# Altium schematic sheet Battery_Charging_Section.SchDoc: =Projectname
size A4; SheetNumber: 3; SheetTotal: 4
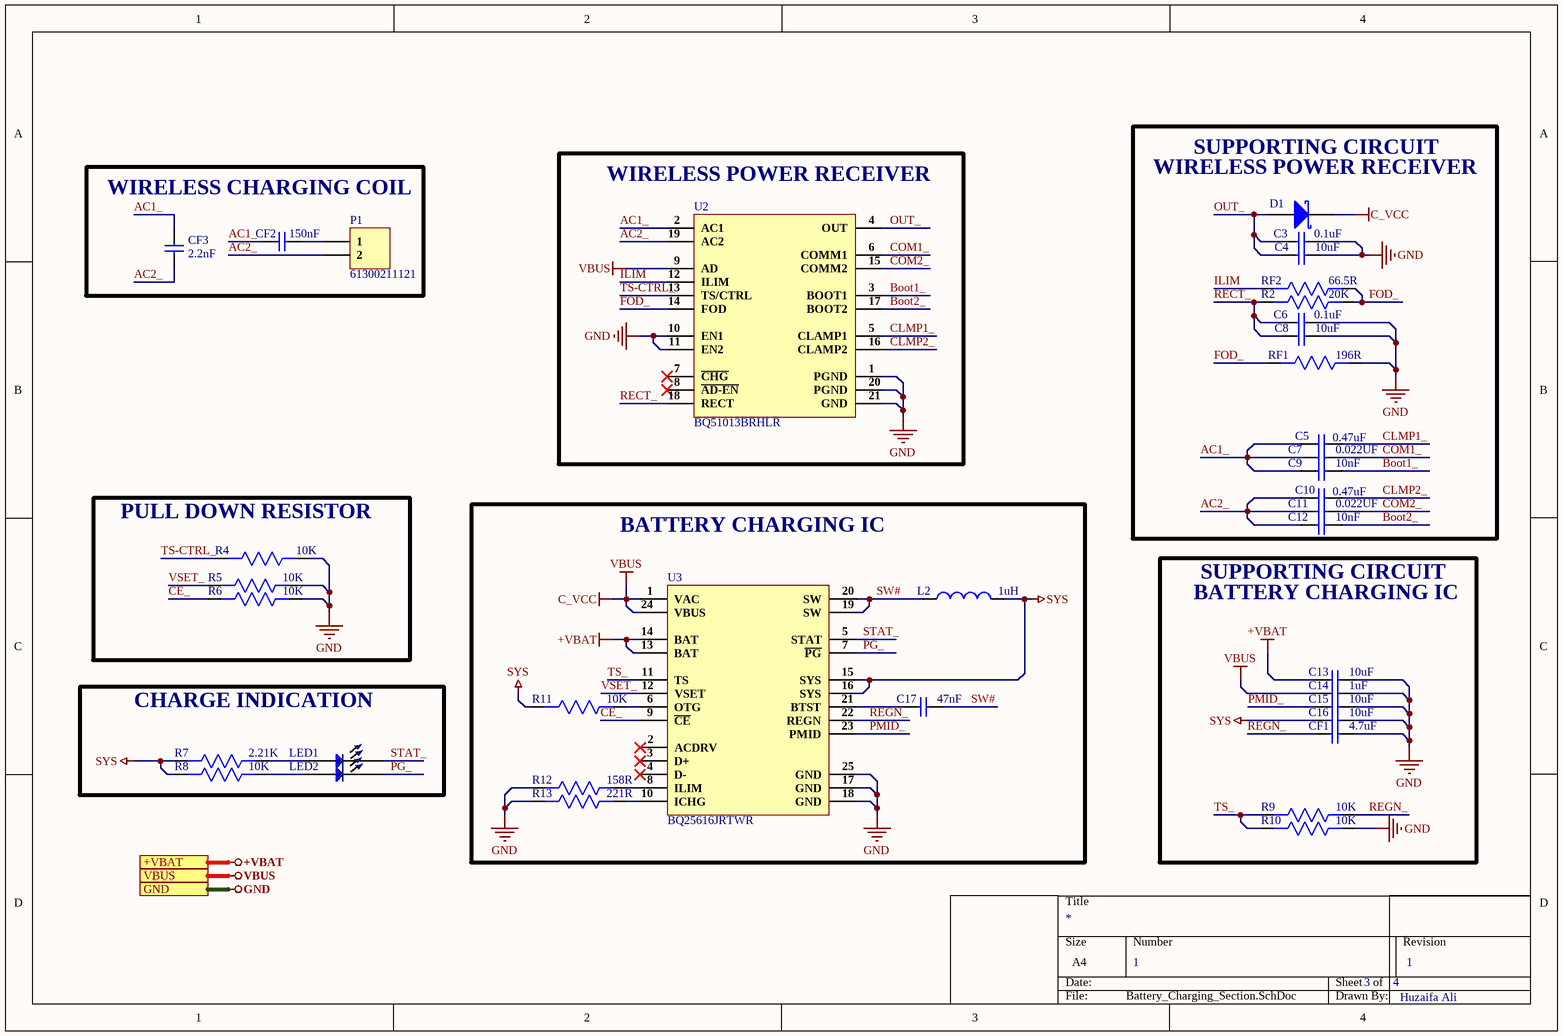
[diagram p0: Battery_Charging_Section.SchDoc]

## Parts
C3  0.1uF  [Cap0402]
C4  10uF  [Cap0805]
C5  0.47uF  [Cap0402]
C6  0.1uF  [Cap0402]
C7  0.022UF  [Cap0402]
C8  10uF  [Cap0805]
C9  10nF  [Cap0402]
C10  0.47uF  [Cap0402]
C11  0.022UF  [Cap0402]
C12  10nF  [Cap0402]
C13  10uF  [Cap0805]
C14  1uF  [Cap0805]
C15  10uF  [Cap0805]
C16  10uF  [Cap0805]
C17  47nF  [Cap0805]
CF1  4.7uF  [Cap0805]
CF2  150nF  [Cap 0603]
CF3  2.2nF  [Cap 0603]
D1  SK56A-LTP  [SMA]  (value not drawn)
L2  1uH  [74404041010]
LED1  LT Q39E-Q1OO-25-1  [LED 0603]  (value not drawn)
LED2  LT Q39E-Q1OO-25-1  [LED 0603]  (value not drawn)
P1  61300211121  [HDR1X2]
R2  20K  [Res0402]
R4  10K  [Res0402]
R5  10K  [Res0402]
R6  10K  [Res0402]
R7  2.21K  [Res0402]
R8  10K  [Res0402]
R9  10K  [Res0402]
R10  10K  [Res0402]
R11  10K  [Res0402]
R12  158R  [Res0402]
R13  221R  [Res0402]
RF1  196R  [Res0402]
RF2  66.5R  [Res0402]
U2  BQ51013BRHLR  [20QFN]
U3  BQ25616JRTWR  [24-WQFN (4x4)]

## Blocks framed on the sheet
WIRELESS CHARGING COIL: CF2 CF3 P1
WIRELESS POWER RECEIVER: U2
PULL DOWN RESISTOR: R4-R6
BATTERY CHARGING IC: C17 L2 R11-R13 U3
CHARGE INDICATION: LED1 LED2 R7 R8

## Ports
+VBAT, GND, VBUS

## Nets
+VBAT: C13.1 U3.13(BAT) U3.14(BAT) ; port +VBAT
C_VCC: C14.1 D1.1(K) U2.9(AD) U3.1(VAC) U3.24(VBUS) ; port VBUS  [also labelled VBUS]
GND: C3.2 C4.2 C6.2 C8.2 C13.2 C14.2 C15.2 C16.2 CF1.2 R4.1 R5.1 R6.1 R10.1 R12.2 R13.2 RF1.1 U2.1(PGND) U2.10(EN1) U2.11(EN2) U2.20(PGND) U2.21(GND) U3.17(GND) U3.18(GND) U3.25(GND) ; port GND
SYS: C16.1 L2.2 R7.2 R8.2 R11.2 U3.15(SYS) U3.16(SYS)
AC1_: C5.1 C7.1 C9.1 CF2.1 CF3.2 U2.2(AC1)
AC2_: C10.1 C11.1 C12.1 CF3.1 P1.2 U2.19(AC2)
Boot1_: C9.2 U2.3(BOOT1)
Boot2_: C12.2 U2.17(BOOT2)
CE_: R6.2 U3.9(~{CE})
CLMP1_: C5.2 U2.5(CLAMP1)
CLMP2_: C10.2 U2.16(CLAMP2)
COM1_: C7.2 U2.6(COMM1)
COM2_: C11.2 U2.15(COMM2)
FOD_: R2.1 RF1.2 RF2.1 U2.14(FOD)
ILIM: RF2.2 U2.12(ILIM)
OUT_: C3.1 C4.1 D1.2(A) U2.4(OUT)
PG_: LED2.2 U3.7(~{PG})
PMID_: C15.1 U3.23(PMID)
RECT_: C6.1 C8.1 R2.2 U2.18(RECT)
REGN_: CF1.1 R9.1 U3.22(REGN)
STAT_: LED1.2 U3.5(STAT)
SW#: C17.2 L2.1 U3.19(SW) U3.20(SW)
TS-CTRL_: R4.2 U2.13(TS/CTRL)
TS_: R9.2 R10.2 U3.11(TS)
VSET_: R5.2 U3.12(VSET)
NetC17_1: C17.1 U3.21(BTST)
NetCF2_2: CF2.2 P1.1
NetLED1_1: LED1.1 R7.1
NetLED2_1: LED2.1 R8.1
NetR11_1: R11.1 U3.6(OTG)
NetR12_1: R12.1 U3.8(ILIM)
NetR13_1: R13.1 U3.10(ICHG)

Not connected (* = marked no-connect by the designer): U2 7(~{CHG})* 8(~{AD-EN})*; U3 2(ACDRV)* 3(D+)* 4(D-)*

## Notes on the sheet
- (near D1) WIRELESS POWER RECEIVER
- SUPPORTING CIRCUIT
- BATTERY CHARGING IC
- 1
- Huzaifa Ali

## Library data of the parts
C3 C6 = GCM155R71C104KA55D: CAP CER 0.1UF 16V X7R 0402; Manufacturer: Murata; Capacitance: 100nF; Tolerance: 10%; Supplier 1: Arrow Electronics; Manufacturer Part Number: GCM155R71C104KA55D; RoHS: Yes; Category: Ceramic Capacitors; Stock 1: 16570000; Pricing 1: 10000=0.01580, 20000=0.00950, 30000=0.00700, 50000=0.00600, 100000=0.00530, 250000=0.00470 (USD); Mount: Surface Mount; Case/Package: 0402; Case Code (Metric): 1005; Case Code (Imperial): 0402; Min Operating Temperature: -55°C; Max Operating Temperature: 125°C; Package Quantity: 1; Packaging: Tape and Reel; Voltage Rating: 16V; Dielectric: X7R; Voltage Rating (DC): 16V; Termination: SMD/SMT; Voltage: 16V; Series: GCM; Construction: Flat; Length: 1mm; Width: 0.02inch; Height: 0.5mm; Thickness: 0.022inch; Depth: 0.5mm; Ratings: AEC-Q200; Radiation Hardening: No; REACH SVHC: No SVHC; Lead Free: Lead Free; RoHS Compliant: Yes; ComponentLink1URL: https://datasheet.ciiva.com/11786/0900766b80ef92d0-11786380.pdf?src-supplier=RSComponents; ComponentLink1Description: https://datasheet.ciiva.com/11786/0900766b80ef92d0-11786380.pdf?src-supplier=RSComponents; ComponentLink2URL: https://datasheet.ciiva.com/18183/getdatasheetpartid-220774-18183517.pdf?src-supplier=Verical; ComponentLink2Description: https://datasheet.ciiva.com/18183/getdatasheetpartid-220774-18183517.pdf?src-supplier=Verical; ComponentLink3URL: https://datasheet.ciiva.com/164/product-164315.pdf?src-supplier=Digi-Key; ComponentLink3Description: https://datasheet.ciiva.com/164/product-164315.pdf?src-supplier=Digi-Key; ComponentLink4URL: https://datasheet.ciiva.com/164/product-164316.pdf?src-supplier=Digi-Key; ComponentLink4Description: https://datasheet.ciiva.com/164/product-164316.pdf?src-supplier=Digi-Key; ComponentLink5URL: https://datasheet.ciiva.com/11463/product-11463804.pdf?src-supplier=Avnet; ComponentLink5Description: https://datasheet.ciiva.com/11463/product-11463804.pdf?src-supplier=Avnet; ComponentLink6URL: https://datasheet.ciiva.com/2989/product-2989234.pdf?src-supplier=Avnet; ComponentLink6Description: https://datasheet.ciiva.com/2989/product-2989234.pdf?src-supplier=Avnet; Supplier Part Number 1: GCM155R71C104KA55D
C4 C8 C13 = CL21A106KOQNNNE: CAP CER 10UF 16V X5R 0805; Manufacturer: Samsung; Tolerance: 10%; Dielectric: X7R; Supplier 1: Arrow Electronics; Manufacturer Part Number: CL21A106KOQNNNE; RoHS: Yes; Category: Ceramic Capacitors; Stock 1: 2592; Pricing 1: 1=0.12910, 10=0.07710, 25=0.07240, 100=0.03710, 250=0.03390, 500=0.02700, 1000=0.02450 (USD); Mount: Surface Mount; Case/Package: 0805; Case Code (Metric): 2012; Case Code (Imperial): 0805; Min Operating Temperature: -55°C; Max Operating Temperature: 85°C; Package Quantity: 1; Packaging: Tape and Reel; Capacitance: 10uF; Voltage Rating: 16V; Voltage Rating (DC): 16V; Series: CL; Construction: Flat; Voltage: 16V; Length: 2mm; Width: 0.049inch; Height: 1.25mm; Thickness: 0.055inch; Depth: 1.25mm; Radiation Hardening: No; Lead Free: Lead Free; RoHS Compliant: Yes; ComponentLink1URL: https://datasheet.ciiva.com/25798/cl21a106koqnnne-25798133.pdf?src-supplier=Digi-Key; ComponentLink1Description: https://datasheet.ciiva.com/25798/cl21a106koqnnne-25798133.pdf?src-supplier=Digi-Key; Supplier Part Number 1: CL21A106KOQNNNE
C5 C10 = CL05A474KA5NNNC: CAP CER 0.47UF 25V X5R 0402; Manufacturer: Samsung; Material: Ceramic; Capacitance: 470nF; Tolerance: 10%; Supplier 1: Arrow Electronics; Manufacturer Part Number: CL05A474KA5NNNC; RoHS: Yes; Category: Ceramic Capacitors; Stock 1: 72150; Pricing 1: 1=0.21210, 10=0.14750, 25=0.14620, 100=0.07650, 250=0.07580, 500=0.04790, 1000=0.04210, 3000=0.03990, 6000=0.03590, 15000=0.03070, 30000=0.02720 (USD); Mount: Surface Mount; Case/Package: 0402; Case Code (Metric): 1005; Case Code (Imperial): 0402; Min Operating Temperature: -55°C; Max Operating Temperature: 85°C; Package Quantity: 1; Packaging: Tape and Reel; Voltage Rating: 25V; Voltage Rating (DC): 25V; Series: CL; Length: 0.039inch; Width: 0.02inch; Thickness: 0.022inch; Lead Free: Lead Free; RoHS Compliant: Yes; ComponentLink1URL: https://datasheet.ciiva.com/25796/cl05a474ka5nnnc-25796037.pdf?src-supplier=Digi-Key; ComponentLink1Description: https://datasheet.ciiva.com/25796/cl05a474ka5nnnc-25796037.pdf?src-supplier=Digi-Key; ComponentLink2URL: https://datasheet.ciiva.com/29198/458859-da-01-en-vs-kondensator-0402-29198303.pdf?src-supplier=Conrad; ComponentLink2Description: https://datasheet.ciiva.com/29198/458859-da-01-en-vs-kondensator-0402-29198303.pdf?src-supplier=Conrad; Supplier Part Number 1: CL05A474KA5NNNC
C7 C11 = GCM155R71E223KA55J: CAP CER 0.022UF 25V X7R 0402; Manufacturer: Murata; Capacitance: 22nF; Tolerance: 10%; Supplier 1: Arrow Electronics; Manufacturer Part Number: GCM155R71E223KA55J; RoHS: Yes; Category: Ceramic Capacitors; Stock 1: 63139; Pricing 1: 1=0.08670, 10=0.04510, 25=0.04370, 100=0.02140, 250=0.02110, 500=0.01450, 1000=0.01190, 3000=0.01110, 6000=0.00980, 15000=0.00910, 30000=0.00900 (USD); Mount: Surface Mount; Case/Package: 0402; Case Code (Metric): 1005; Case Code (Imperial): 0402; Min Operating Temperature: -55°C; Max Operating Temperature: 125°C; Package Quantity: 50000; Packaging: Tape and Reel; Voltage Rating: 25V; Voltage Rating (DC): 25V; Dielectric: X7R; Termination: SMD/SMT; Series: GCM; Construction: Flat; Length: 1mm; Width: 0.02inch; Height: 0.5mm; Thickness: 0.022inch; Depth: 0.5mm; Ratings: AEC-Q200; Radiation Hardening: No; RoHS Compliant: Yes; ComponentLink1URL: https://datasheet.ciiva.com/11619/product-11619415.pdf?src-supplier=Avnet; ComponentLink1Description: https://datasheet.ciiva.com/11619/product-11619415.pdf?src-supplier=Avnet; ComponentLink2URL: https://datasheet.ciiva.com/29534/s0717e-29534409.pdf?src-supplier=Digi-Key; ComponentLink2Description: https://datasheet.ciiva.com/29534/s0717e-29534409.pdf?src-supplier=Digi-Key; ComponentLink3URL: https://datasheet.ciiva.com/29534/s0717e-29534410.pdf?src-supplier=Digi-Key; ComponentLink3Description: https://datasheet.ciiva.com/29534/s0717e-29534410.pdf?src-supplier=Digi-Key; ComponentLink4URL: https://datasheet.ciiva.com/29534/s0717e-29534411.pdf?src-supplier=Digi-Key; ComponentLink4Description: https://datasheet.ciiva.com/29534/s0717e-29534411.pdf?src-supplier=Digi-Key; Supplier Part Number 1: GCM155R71E223KA55J
C9 C12 = GRM155R71E103KA01D: CAP CER 10000PF 25V X7R 0402; Manufacturer: Murata; Material: Ceramic; Tolerance: 10%; Insulation Resistance: 10GR; Supplier 1: Arrow Electronics; Manufacturer Part Number: GRM155R71E103KA01D; RoHS: Yes; Category: Ceramic Capacitors; Stock 1: 1060000; Pricing 1: 10000=0.00570, 20000=0.00440, 30000=0.00290, 50000=0.00280, 100000=0.00220 (USD); Mount: Surface Mount; Case/Package: 0402; Number of Pins: 2; Case Code (Imperial): 0402; Case Code (Metric): 1005; Dielectric Material: Ceramic; Min Operating Temperature: -55°C; Max Operating Temperature: 125°C; Capacitance: 10nF; Packaging: Tape and Reel; Voltage Rating: 25V; Voltage Rating (DC): 25V; Package Quantity: 1; Dielectric: X7R; Termination: SMD/SMT; Voltage: 25V; Series: GRM; Construction: Flat; Length: 1mm; Width: 0.5mm; Height: 0.5mm; Thickness: 0.022inch; Depth: 0.5mm; Radiation Hardening: No; REACH SVHC: No SVHC; Lead Free: Lead Free; RoHS Compliant: Yes; ComponentLink1URL: https://datasheet.ciiva.com/28534/1699889-28534148.pdf?src-supplier=Element14; ComponentLink1Description: https://datasheet.ciiva.com/28534/1699889-28534148.pdf?src-supplier=Element14; ComponentLink2URL: https://datasheet.ciiva.com/129/partnumbering-e-01-129742.pdf?src-supplier=Digi-Key; ComponentLink2Description: https://datasheet.ciiva.com/129/partnumbering-e-01-129742.pdf?src-supplier=Digi-Key; ComponentLink3URL: https://datasheet.ciiva.com/129/partnumbering-e-01-129741.pdf?src-supplier=Digi-Key; ComponentLink3Description: https://datasheet.ciiva.com/129/partnumbering-e-01-129741.pdf?src-supplier=Digi-Key; ComponentLink4URL: https://datasheet.ciiva.com/129/partnumbering-e-01-129743.pdf?src-supplier=Digi-Key; ComponentLink4Description: https://datasheet.ciiva.com/129/partnumbering-e-01-129743.pdf?src-supplier=Digi-Key; ComponentLink5URL: https://datasheet.ciiva.com/11786/0900766b807a1cab-11786320.pdf?src-supplier=RSComponents; ComponentLink5Description: https://datasheet.ciiva.com/11786/0900766b807a1cab-11786320.pdf?src-supplier=RSComponents; ComponentLink6URL: https://datasheet.ciiva.com/3777/3813grm155r71e103ka0123-3777115.pdf?src-supplier=Arrow+Electronics; ComponentLink6Description: https://datasheet.ciiva.com/3777/3813grm155r71e103ka0123-3777115.pdf?src-supplier=Arrow+Electronics; ComponentLink7URL: https://datasheet.ciiva.com/18184/getdatasheetpartid-161489-18184689.pdf?src-supplier=Verical; ComponentLink7Description: https://datasheet.ciiva.com/18184/getdatasheetpartid-161489-18184689.pdf?src-supplier=Verical; ComponentLink8URL: https://datasheet.ciiva.com/29199/454154-da-01-en-vs-kondensator-0402-29199817.pdf?src-supplier=Conrad; ComponentLink8Description: https://datasheet.ciiva.com/29199/454154-da-01-en-vs-kondensator-0402-29199817.pdf?src-supplier=Conrad; ComponentLink9URL: https://datasheet.ciiva.com/7937/1747448-7937621.pdf?src-supplier=Element14; ComponentLink9Description: https://datasheet.ciiva.com/7937/1747448-7937621.pdf?src-supplier=Element14; ComponentLink10URL: https://datasheet.ciiva.com/16199/product-16199034.pdf?src-supplier=Future+Electronics; ComponentLink10Description: https://datasheet.ciiva.com/16199/product-16199034.pdf?src-supplier=Future+Electronics; Supplier Part Number 1: GRM155R71E103KA01D
C14 = GCM21BR71E105KA56L: CAP CER 1UF 25V X7R 0805; Manufacturer: Murata; Tolerance: 10%; Supplier 1: Arrow Electronics; Manufacturer Part Number: GCM21BR71E105KA56L; RoHS: Yes; Category: Ceramic Capacitors; Stock 1: 120000; Pricing 1: 3000=0.07110, 6000=0.06620, 12000=0.05840 (USD); Mount: Surface Mount; Case/Package: 0805; Case Code (Metric): 2012; Case Code (Imperial): 0805; Min Operating Temperature: -55°C; Max Operating Temperature: 125°C; Capacitance: 1uF; Dielectric: X7R; Package Quantity: 3000; Voltage Rating: 25V; Packaging: Tape and Reel; Termination: SMD/SMT; Voltage: 25V; Voltage Rating (DC): 25V; Series: GCM; Construction: Flat; Length: 2mm; Width: 0.049inch; Height: 1.25mm; Thickness: 0.055inch; Depth: 1.25mm; Ratings: AEC-Q200; Radiation Hardening: No; REACH SVHC: No SVHC; Lead Free: Lead Free; RoHS Compliant: Yes; ComponentLink1URL: https://datasheet.ciiva.com/137/product-137199.pdf?src-supplier=Digi-Key; ComponentLink1Description: https://datasheet.ciiva.com/137/product-137199.pdf?src-supplier=Digi-Key; ComponentLink2URL: https://datasheet.ciiva.com/11789/0900766b80ef92d0-11789092.pdf?src-supplier=RSComponents; ComponentLink2Description: https://datasheet.ciiva.com/11789/0900766b80ef92d0-11789092.pdf?src-supplier=RSComponents; ComponentLink3URL: https://datasheet.ciiva.com/3778/359gcm21br71e105ka5623-3778560.pdf?src-supplier=Arrow+Electronics; ComponentLink3Description: https://datasheet.ciiva.com/3778/359gcm21br71e105ka5623-3778560.pdf?src-supplier=Arrow+Electronics; ComponentLink4URL: https://datasheet.ciiva.com/18183/getdatasheetpartid-153106-18183696.pdf?src-supplier=Verical; ComponentLink4Description: https://datasheet.ciiva.com/18183/getdatasheetpartid-153106-18183696.pdf?src-supplier=Verical; ComponentLink5URL: https://datasheet.ciiva.com/137/product-137200.pdf?src-supplier=Digi-Key; ComponentLink5Description: https://datasheet.ciiva.com/137/product-137200.pdf?src-supplier=Digi-Key; ComponentLink6URL: https://datasheet.ciiva.com/137/product-137201.pdf?src-supplier=Digi-Key; ComponentLink6Description: https://datasheet.ciiva.com/137/product-137201.pdf?src-supplier=Digi-Key; ComponentLink7URL: https://datasheet.ciiva.com/2989/product-2989245.pdf?src-supplier=Avnet; ComponentLink7Description: https://datasheet.ciiva.com/2989/product-2989245.pdf?src-supplier=Avnet; ComponentLink8URL: https://datasheet.ciiva.com/2989/product-2989246.pdf?src-supplier=Avnet; ComponentLink8Description: https://datasheet.ciiva.com/2989/product-2989246.pdf?src-supplier=Avnet; Supplier Part Number 1: GCM21BR71E105KA56L
C15 C16 = TMK212BBJ106KGHT: CAP CER 10UF 25V X5R 0805; Manufacturer: Taiyo Yuden; Tolerance: 10%; Supplier 1: Newark; Manufacturer Part Number: TMK212BBJ106KGHT; RoHS: Yes; Category: Ceramic Capacitors; Stock 1: 26354; Pricing 1: 1=0.06100, 25=0.06100, 50=0.06100, 100=0.06100, 250=0.06100, 500=0.05600 (USD); Mount: Surface Mount; Case/Package: 0805; Case Code (Metric): 2012; Case Code (Imperial): 0805; Weight: 0.000194oz; Min Operating Temperature: -55°C; Max Operating Temperature: 85°C; Capacitance: 10uF; Packaging: Tape and Reel; Voltage Rating: 25V; Dielectric: X5R; Termination: SMD/SMT; Voltage Rating (DC): 25V; Package Quantity: 3000; Length: 0.079inch; Width: 0.049inch; Height: 1.25mm; Thickness: 0.053inch; Ratings: AEC-Q200; RoHS Compliant: Yes; ComponentLink1URL: http://www.mouser.com/ds/2/396/mlcc11_hq_e-541564.pdf?src-supplier=Mouser; ComponentLink1Description: http://www.mouser.com/ds/2/396/mlcc11_hq_e-541564.pdf?src-supplier=Mouser; ComponentLink2URL: https://www.yuden.co.jp/productdata/catalog/mlcc_all_hq_e.pdf?src-supplier=Digi-Key; ComponentLink2Description: https://www.yuden.co.jp/productdata/catalog/mlcc_all_hq_e.pdf?src-supplier=Digi-Key; ComponentLink3URL: http://ds.yuden.co.jp/TYCOMPAS/ut/detail.do?productNo=TMK212BBJ106KGHT&fileName=TMK212BBJ106KGHT_SS&mode=specSheetDownload&src-supplier=Digi-Key; ComponentLink3Description: http://ds.yuden.co.jp/TYCOMPAS/ut/detail.do?productNo=TMK212BBJ106KGHT&fileName=TMK212BBJ106KGHT_SS&mode=specSheetDownload&src-supplier=Digi-Key; ComponentLink4URL: http://ds.yuden.co.jp/TYCOMPAS/ut/detail.do?productNo=TMK212BBJ106KGHT&dataUnit=M&src-supplier=Avnet; ComponentLink4Description: http://ds.yuden.co.jp/TYCOMPAS/ut/detail.do?productNo=TMK212BBJ106KGHT&dataUnit=M&src-supplier=Avnet; Supplier Part Number 1: 95Y2170
C17 = CC0805KRX7R8BB473: CAP CER 0.047UF 25V X7R 0805; Manufacturer: Yageo; Dielectric Material: Ceramic; Tolerance: 10%; Insulation Resistance: 100GR; Supplier 1: Mouser; Manufacturer Part Number: CC0805KRX7R8BB473; RoHS: Yes; Category: Ceramic Capacitors; Stock 1: 20092; Pricing 1: 1=0.15000, 10=0.10200, 50=0.10200, 100=0.04800, 1000=0.02900, 10000=0.02100 (USD); Mount: Surface Mount; Case/Package: 0805; Case Code (Metric): 2012; Case Code (Imperial): 0805; Weight: 0.000194oz; Min Operating Temperature: -55°C; Max Operating Temperature: 125°C; Capacitance: 47nF; Dielectric: X7R; Voltage Rating: 25V; Voltage Rating (DC): 25V; Packaging: Tape and Reel; Termination: SMD/SMT; Resistor Type: Ceramic; Series: CC; Construction: Flat; Length: 2mm; Width: 0.049inch; Height: 0.85mm; Depth: 1.25mm; Thickness: 0.037inch; Radiation Hardening: No; REACH SVHC: Unknown; Lead Free: Lead Free; Halogen Free: Halogen Free; RoHS Compliant: Yes; ComponentLink1URL: https://datasheet.ciiva.com/13207/yageo-486313-494411-13207758.pdf?src-supplier=Mouser; ComponentLink1Description: https://datasheet.ciiva.com/13207/yageo-486313-494411-13207758.pdf?src-supplier=Mouser; ComponentLink2URL: https://datasheet.ciiva.com/11465/upy-gphc-x7r-6-3v-to-50v-8-11465303.pdf?src-supplier=Avnet; ComponentLink2Description: https://datasheet.ciiva.com/11465/upy-gphc-x7r-6-3v-to-50v-8-11465303.pdf?src-supplier=Avnet; Supplier Part Number 1: 603-CC805KRX7R8BB473
CF1 = CL21A475KPFNNNE: CAP CER 4.7UF 10V X5R 0805; Manufacturer: Samsung; Tolerance: 10%; Supplier 1: Arrow Electronics; Manufacturer Part Number: CL21A475KPFNNNE; RoHS: Yes; Category: Ceramic Capacitors; Stock 1: 282000; Pricing 1: 2000=0.01590, 4000=0.01450, 10000=0.01240, 14000=0.01230, 50000=0.00940 (USD); Mount: Surface Mount; Case/Package: 0805; Case Code (Metric): 2012; Case Code (Imperial): 0805; Contact Plating: Tin; Min Operating Temperature: -55°C; Max Operating Temperature: 85°C; Package Quantity: 1; Packaging: Tape and Reel; Capacitance: 4.7uF; Voltage Rating: 10V; Dielectric: X5R; Series: CL; Construction: Flat; Voltage Rating (DC): 10V; Length: 2mm; Width: 0.049inch; Height: 1.25mm; Thickness: 0.053inch; Depth: 1.25mm; Radiation Hardening: No; RoHS Compliant: Yes; Lead Free: Lead Free; ComponentLink1URL: https://datasheet.ciiva.com/25766/cl21a475kpfnnne-25766898.pdf?src-supplier=Digi-Key; ComponentLink1Description: https://datasheet.ciiva.com/25766/cl21a475kpfnnne-25766898.pdf?src-supplier=Digi-Key; ComponentLink2URL: https://datasheet.ciiva.com/15216/getdatasheetpartid-358357-15216235.pdf?src-supplier=Verical; ComponentLink2Description: https://datasheet.ciiva.com/15216/getdatasheetpartid-358357-15216235.pdf?src-supplier=Verical; ComponentLink3URL: https://datasheet.ciiva.com/26310/mlcc-catalogdownload2013-eng-26310173.pdf?src-supplier=Distrelec; ComponentLink3Description: https://datasheet.ciiva.com/26310/mlcc-catalogdownload2013-eng-26310173.pdf?src-supplier=Distrelec; ComponentLink4URL: https://datasheet.ciiva.com/16374/cl05b104kq5nnnc-16374138.pdf?src-supplier=Future+Electronics; ComponentLink4Description: https://datasheet.ciiva.com/16374/cl05b104kq5nnnc-16374138.pdf?src-supplier=Future+Electronics; Supplier Part Number 1: CL21A475KPFNNNE
CF2 = 0603F154Z250CT: 25V 150nF Y5V -20%~+80% 0603 Multilayer Ceramic Capacitors MLCC - SMD/SMT ROHS; Manufacturer: Walsin Tech Corp; Manufacturer Part Number: 0603F154Z250CT; Mount: Surface Mount; Case/Package: 0603; Case Code (Metric): 1608; Tolerance: -20%~+80%; Capacitance: 150nF; ComponentLink1Description: LCSC; ComponentLink1URL: https://www.lcsc.com/product-detail/Multilayer-span-style-background-color-ff0-Ceramic-span-Capacitors-MLCC-SMD-SMT_Walsin-Tech-Corp-0603F154Z250CT_C237182.html; Voltage: 25V
CF3 = CC0603JRX7R8BB222: 25V 2.2nF X7R ±5% 0603 Multilayer Ceramic Capacitors MLCC - SMD/SMT ROHS; Manufacturer: Walsin Tech Corp; Manufacturer Part Number: CC0603JRX7R8BB222; Mount: Surface Mount; Case/Package: 0603; Case Code (Metric): 1608; Tolerance: ±5%; Capacitance: 2.2nF; ComponentLink1Description: LCSC; ComponentLink1URL: https://www.lcsc.com/product-detail/Multilayer-span-style-background-color-ff0-Ceramic-span-Capacitors-MLCC-SMD-SMT_YAGEO-CC0603JRX7R8BB222_C519522.html; Voltage: 25V
D1 = SK56A-LTP: DIODE SCHOTTKY 5A 60V SMA; Manufacturer: MCC; Supplier 1: Arrow Electronics; Manufacturer Part Number: SK56A-LTP; RoHS: Yes; Category: Rectifier Diodes; Stock 1: 4792; Pricing 1: 1=0.50900, 10=0.41320, 100=0.28100, 500=0.21080, 1000=0.15810, 2000=0.14490, 5000=0.13610, 10000=0.12730, 25000=0.11980 (USD); Mount: Surface Mount; Case/Package: SMA; Packaging: Tape and Reel; Average Rectified Current: 5A; Max Reverse Voltage (DC): 60V; RoHS Compliant: Yes; ComponentLink1URL: http://www.mccsemi.com/up_pdf/SK52A-L-SK510A-L(DO-214AC).pdf?src-supplier=Digi-Key; ComponentLink1Description: http://www.mccsemi.com/up_pdf/SK52A-L-SK510A-L(DO-214AC).pdf?src-supplier=Digi-Key; Supplier Part Number 1: SK56A-LTP
L2 = 74404041010: Fixed Ind 1UH 2.52A 41 Mohm SMD; Manufacturer: Wurth Electronics; Saturation Current: 3.35A; Shielding: Shielded; DC Resistance (DCR): 41mR; Self Resonant Frequency: 142MHz; Test Frequency: 100kHz; Tolerance: 30%; Supplier 1: Newark; Manufacturer Part Number: 74404041010; RoHS: Yes; Category: Fixed Inductors; Stock 1: 200; Pricing 1: 10=1.15000, 25=1.05000, 50=0.95300, 100=0.87100, 250=0.74200 (USD); Mount: Surface Mount; Case/Package: Nonstandard; Min Operating Temperature: -40°C; Max Operating Temperature: 125°C; Packaging: Tape and Reel; Resistor Type: Wirewound; Inductance: 1uH; Current Rating: 2.52A; Length: 0.157inch; Width: 0.146inch; Height - Seated (Max): 0.047inch; RoHS Compliant: Yes; ComponentLink1URL: https://katalog.we-online.de/pbs/datasheet/74404041010.pdf?src-supplier=Digi-Key; ComponentLink1Description: https://katalog.we-online.de/pbs/datasheet/74404041010.pdf?src-supplier=Digi-Key; Supplier Part Number 1: 75AJ2600
LED1 LED2 = LT Q39E-Q1OO-25-1: LED GREEN DIFFUSED 0603 SMD; Manufacturer: Osram Opto; Lens Color: White; Lens Style: Flat,Diffused,Colorless,Rectangular; Viewing Angle: 130°; Luminous Intensity: 175.5mcd; Forward Current: 15mA; Forward Voltage: 2.85V; Luminous Flux: 0.34lm; Test Current: 5mA; Dominant Wavelength: 530nm; Number of Elements: 1; Lens Size: 0.8mm; Supplier 1: RSComponents; Manufacturer Part Number: LTQ39E-Q1OO-25-1; RoHS: Yes; Category: LEDs; Stock 1: 1; Pricing 1: 10=0.31600, 100=0.16800, 200=0.16400, 1000=0.16100, 2000=0.11500 (USD); Mount: Surface Mount; Case/Package: SMD/SMT; Number of Pins: 2; Color: Green; Case Code (Imperial): 0603; Case Code (Metric): 1608; Min Operating Temperature: -40°C; Max Operating Temperature: 85°C; Packaging: Tape and Reel; Number of LEDs: 1; Lens Transparency: Diffused; Package Quantity: 16000; Series: CHIPLED 0603; Length: 1.6mm; Width: 0.8mm; Depth: 0.9mm; Radiation Hardening: No; RoHS Compliant: Yes; ComponentLink1URL: http://www.mouser.com/ds/2/311/LT%20Q39E%20-%20CHIPLED%200603-318171.pdf?src-supplier=Mouser; ComponentLink1Description: http://www.mouser.com/ds/2/311/LT%20Q39E%20-%20CHIPLED%200603-318171.pdf?src-supplier=Mouser; ComponentLink2URL: http://components.arrow.com/part/dataview/48286240S9138660N2128?src-supplier=Arrow+Electronics; ComponentLink2Description: http://components.arrow.com/part/dataview/48286240S9138660N2128?src-supplier=Arrow+Electronics; ComponentLink3URL: https://dammedia.osram.info/media/resource/hires/osram-dam-2493475/LT%20Q39E.pdf?src-supplier=Digi-Key; ComponentLink3Description: https://dammedia.osram.info/media/resource/hires/osram-dam-2493475/LT%20Q39E.pdf?src-supplier=Digi-Key; ComponentLink4URL: http://www.osram-os.com/Graphics/XPic7/00185661_0.pdf?src-supplier=Digi-Key; ComponentLink4Description: http://www.osram-os.com/Graphics/XPic7/00185661_0.pdf?src-supplier=Digi-Key; ComponentLink5URL: http://catalog.osram-os.com/jsp/download.jsp?rootPath=/media/&name=LB_LT_Q39E.pdf&docPath=Graphics/00052413_0.pdf&url=/media//_en/Graphics/00052413_0.pdf&src-supplier=Avnet; ComponentLink5Description: http://catalog.osram-os.com/jsp/download.jsp?rootPath=/media/&name=LB_LT_Q39E.pdf&docPath=Graphics/00052413_0.pdf&url=/media//_en/Graphics/00052413_0.pdf&src-supplier=Avnet; ComponentLink6URL: http://www.osram-os.com/Graphics/XPic7/00185661_0.pdf/LT%20Q39E%20-%20CHIPLED%200603.pdf?src-supplier=Avnet; ComponentLink6Description: http://www.osram-os.com/Graphics/XPic7/00185661_0.pdf/LT%20Q39E%20-%20CHIPLED%200603.pdf?src-supplier=Avnet; Supplier Part Number 1: 6973718
P1 = 61300211121: CONN HEADER VERT 2POS 2.54MM; Manufacturer: Wurth Electronics; Current Rating: 3A; Voltage Rating: 250V; Number of Positions: 2; Gender: Male; Connector Type: Male Pin; Pitch: 0.1inch; Supplier 1: Digi-Key; Manufacturer Part Number: 61300211121; Stock 1: 219205; Pricing 1: 1=0.13, 10=0.106, 25=0.088, 50=0.074, 100=0.067, 1000=0.061 (USD); Mount: Through Hole; Contact Plating: Gold; Housing Material: PBT; Contact Material: Copper Alloy,Copper; Color: Black; Min Operating Temperature: -40°C; Max Operating Temperature: 125°C; Number of Rows: 1; Contact Gender: Male; Packaging: Bulk; Termination: Through Hole; Number of Contacts: 2; Contact Mating Length: 0.236inch; REACH SVHC: Unknown; Lead Free: Lead Free; ComponentLink1URL: http://www.mouser.com/ds/2/445/6130xx11121-538006.pdf?src-supplier=Mouser; ComponentLink1Description: http://www.mouser.com/ds/2/445/6130xx11121-538006.pdf?src-supplier=Mouser; Supplier Part Number 1: 732-5315-ND
R2 = RMCF0402JT20K0: RES 20K OHM 5% 1/16W 0402; Manufacturer: Stackpole Electronics; Resistance: 20kR; Power Rating: 63mW; Temperature Coefficient: 100ppm/°C; Supplier 1: Arrow Electronics; Manufacturer Part Number: RMCF0402JT20K0; RoHS: Yes; Category: Chip SMD Resistors; Stock 1: 30000; Pricing 1: 10000=0.00150, 30000=0.00130, 50000=0.00120 (USD); Mount: Surface Mount; Case/Package: 0402; Case Code (Metric): 1005; Case Code (Imperial): 0402; Contact Plating: Tin,Matte; Size Code: 0402; Min Operating Temperature: -55°C; Max Operating Temperature: 155°C; Tolerance: 5%; Packaging: Tape and Reel; Resistor Type: Thick Film; Number of Terminations: 2; Max Power Dissipation: 63mW; Features: Automotive AEC-Q200; Series: RMCF; Construction: Rectangular; Length: 0.039inch; Width: 0.02inch; Height: 0.016inch; Depth: 0.5mm; Military Standard: Not; Lead Free: Lead Free; RoHS Compliant: Yes; ComponentLink1URL: http://www.seielect.com/Catalog/SEI-rmc.pdf?src-supplier=Future+Electronics; ComponentLink1Description: http://www.seielect.com/Catalog/SEI-rmc.pdf?src-supplier=Future+Electronics; ComponentLink2URL: https://www.seielect.com/Catalog/SEI-RMCF_RMCP.pdf?src-supplier=Avnet; ComponentLink2Description: https://www.seielect.com/Catalog/SEI-RMCF_RMCP.pdf?src-supplier=Avnet; ComponentLink3URL: https://www.seielect.com/catalog/SEI-Packaging.pdf?src-supplier=Digi-Key; ComponentLink3Description: https://www.seielect.com/catalog/SEI-Packaging.pdf?src-supplier=Digi-Key; ComponentLink4URL: https://www.seielect.com/Catalog/SEI-RMCF_RMCP.pdf?src-supplier=Digi-Key; ComponentLink4Description: https://www.seielect.com/Catalog/SEI-RMCF_RMCP.pdf?src-supplier=Digi-Key; ComponentLink5URL: http://components.arrow.com/part/dataview/50569084S772884N1174?src-supplier=Arrow+Electronics; ComponentLink5Description: http://components.arrow.com/part/dataview/50569084S772884N1174?src-supplier=Arrow+Electronics; Supplier Part Number 1: RMCF0402JT20K0
R4-R6 R8-R11 = RC0402JR-0710KP: RES SMD 10K OHM 5% 1/16W 0402; Manufacturer: Yageo; Resistance: 10kR; Max Power Dissipation: 63mW; Temperature Coefficient: 150ppm/°C; Supplier 1: Arrow Electronics; Manufacturer Part Number: RC0402JR-0710KP; RoHS: Yes; Category: Chip SMD Resistors; Stock 1: 70000; Pricing 1: 10000=0.00290, 20000=0.00280 (USD); Case/Package: 0402; Case Code (Metric): 1005; Case Code (Imperial): 0402; Min Operating Temperature: -55°C; Max Operating Temperature: 155°C; Packaging: Cut Tape; Resistor Type: Thick Film; Number of Terminations: 2; Tolerance: 5%; Features: Moisture Resistant; Length: 0.039inch; Width: 0.02inch; Height: 0.016inch; RoHS Compliant: Yes; ComponentLink1URL: http://www.yageo.com/NewPortal/yageodocoutput?fileName=/pdf/R-Chip/PYu-RC_51_RoHS_P_0.pdf&src-supplier=Digi-Key; ComponentLink1Description: http://www.yageo.com/NewPortal/yageodocoutput?fileName=/pdf/R-Chip/PYu-RC_51_RoHS_P_0.pdf&src-supplier=Digi-Key; Supplier Part Number 1: RC0402JR-0710KP
R7 = AT0402BRD072K21L: RES SMD 2.21KOHM 0.1% 1/16W 0402; Manufacturer: Yageo; Resistance: 2.21kR; Max Power Dissipation: 63mW; Temperature Coefficient: 25ppm/°C; Supplier 1: Future Electronics; Manufacturer Part Number: AT0402BRD072K21L; RoHS: Yes; Category: Chip SMD Resistors; Stock 1: 10000; Pricing 1: 10000=0.08590, 20000=0.06460, 30000=0.06390 (USD); Case/Package: 0402; Min Operating Temperature: -55°C; Max Operating Temperature: 155°C; Packaging: Tape and Reel; Resistor Type: Thin Film; Number of Terminations: 2; Tolerance: 0.1%; Features: Moisture Resistant,Automotive AEC-Q200,Anti-Sulfur; Length: 0.039inch; Width: 0.02inch; Height: 0.014inch; RoHS Compliant: Yes; ComponentLink1URL: http://www.yageo.com/documents/recent/PYu-AT_51_RoHS_L_5.pdf?src-supplier=Digi-Key; ComponentLink1Description: http://www.yageo.com/documents/recent/PYu-AT_51_RoHS_L_5.pdf?src-supplier=Digi-Key; Supplier Part Number 1: 2145812
R12 = RC0402FR-07158RL: RES 158 OHM 1% 1/16W 0402; Manufacturer: Yageo; Temperature Coefficient: 100ppm/°C; Voltage Rating: 50V; Power Rating: 62.5mW; Max Power Dissipation: 63mW; Supplier 1: Arrow Electronics; Manufacturer Part Number: RC0402FR-07158RL; RoHS: Yes; Category: Chip SMD Resistors; Stock 1: 12524; Pricing 1: 1=0.09680, 10=0.02060, 25=0.01740, 100=0.00620, 250=0.00570, 500=0.00490, 1000=0.00310 (USD); Case/Package: 0402; Contact Plating: Tin,Matte,Lead; Case Code (Imperial): 0402; Case Code (Metric): 1005; Min Operating Temperature: -55°C; Max Operating Temperature: 155°C; Resistance: 158R; Tolerance: 1%; Resistor Type: Thick Film; Package Quantity: 10000; Packaging: Tape and Reel; Number of Terminations: 2; Termination: SMD/SMT; Voltage Rating (DC): 50V; Working Voltage: 50V; Features: Moisture Resistant; Series: RC; Construction: Rectangular; Technology: THICK FILM; Length: 1mm; Width: 0.02inch; Height: 0.016inch; Depth: 0.5mm; Radiation Hardening: No; Military Standard: Not; Lead Free: Lead Free; RoHS Compliant: Yes; ComponentLink1URL: https://datasheet.ciiva.com/12575/pyu-rc0402-51-rohs-l-6-r-8721-12575276.pdf?src-supplier=Mouser; ComponentLink1Description: https://datasheet.ciiva.com/12575/pyu-rc0402-51-rohs-l-6-r-8721-12575276.pdf?src-supplier=Mouser; ComponentLink2URL: https://datasheet.ciiva.com/8887/pyu-rc0402-51-rohs-l-6-8887228.pdf?src-supplier=Avnet; ComponentLink2Description: https://datasheet.ciiva.com/8887/pyu-rc0402-51-rohs-l-6-8887228.pdf?src-supplier=Avnet; ComponentLink3URL: https://datasheet.ciiva.com/16744/pyu-rc0402-51-rohs-l-6-r-16744012.pdf?src-supplier=Future+Electronics; ComponentLink3Description: https://datasheet.ciiva.com/16744/pyu-rc0402-51-rohs-l-6-r-16744012.pdf?src-supplier=Future+Electronics; Supplier Part Number 1: RC0402FR-07158RL
R13 = RC0402FR-07221RL: RES 221 OHM 1% 1/16W 0402; Manufacturer: Yageo; Power Rating: 62.5mW; Voltage Rating: 50V; Temperature Coefficient: 100ppm/°C; Max Power Dissipation: 63mW; Supplier 1: Arrow Electronics; Manufacturer Part Number: RC0402FR-07221RL; RoHS: Yes; Category: Chip SMD Resistors; Stock 1: 70000; Pricing 1: 10000=0.00150 (USD); Case/Package: 0402; Case Code (Metric): 1005; Case Code (Imperial): 0402; Size Code: 0402; Min Operating Temperature: -55°C; Max Operating Temperature: 155°C; Package Quantity: 1; Resistance: 221R; Tolerance: 1%; Packaging: Tape and Reel; Resistor Type: Thick Film; Number of Terminations: 2; Termination: SMD/SMT; Features: Moisture Resistant; Series: RC; Construction: Rectangular; Length: 1mm; Width: 0.02inch; Height: 0.016inch; Depth: 0.5mm; Military Standard: Not; Lead Free: Lead Free; RoHS Compliant: Yes; ComponentLink1URL: https://datasheet.ciiva.com/2519/pyu-r-int-thick-7-2519025.pdf?src-supplier=Digi-Key; ComponentLink1Description: https://datasheet.ciiva.com/2519/pyu-r-int-thick-7-2519025.pdf?src-supplier=Digi-Key; ComponentLink2URL: https://datasheet.ciiva.com/2519/pyu-r-int-thick-7-2519026.pdf?src-supplier=Digi-Key; ComponentLink2Description: https://datasheet.ciiva.com/2519/pyu-r-int-thick-7-2519026.pdf?src-supplier=Digi-Key; ComponentLink3URL: https://datasheet.ciiva.com/2519/pyu-r-int-thick-7-2519024.pdf?src-supplier=Digi-Key; ComponentLink3Description: https://datasheet.ciiva.com/2519/pyu-r-int-thick-7-2519024.pdf?src-supplier=Digi-Key; ComponentLink4URL: https://datasheet.ciiva.com/12666/pyu-rc0402-51-rohs-l-6-r-12666726.pdf?src-supplier=Mouser; ComponentLink4Description: https://datasheet.ciiva.com/12666/pyu-rc0402-51-rohs-l-6-r-12666726.pdf?src-supplier=Mouser; ComponentLink5URL: https://datasheet.ciiva.com/17419/pyu-rc0402-51-rohs-l-6-r-17419495.pdf?src-supplier=Future+Electronics; ComponentLink5Description: https://datasheet.ciiva.com/17419/pyu-rc0402-51-rohs-l-6-r-17419495.pdf?src-supplier=Future+Electronics; Supplier Part Number 1: RC0402FR-07221RL
RF1 = RC0402FR-07196RL: RES 196 OHM 1% 1/16W 0402; Manufacturer: Yageo; Temperature Coefficient: 100ppm/°C; Voltage Rating: 50V; Power Rating: 62.5mW; Max Power Dissipation: 63mW; Supplier 1: Arrow Electronics; Manufacturer Part Number: RC0402FR-07196RL; RoHS: Yes; Category: Chip SMD Resistors; Stock 1: 13037; Pricing 1: 1=0.09750, 10=0.01520, 25=0.01330, 100=0.00540, 250=0.00430, 1000=0.00270, 3000=0.00210 (USD); Case/Package: 0402; Contact Plating: Tin,Matte,Lead; Case Code (Imperial): 0402; Case Code (Metric): 1005; Min Operating Temperature: -55°C; Max Operating Temperature: 155°C; Tolerance: 1%; Resistance: 196R; Resistor Type: Thick Film; Packaging: Tape and Reel; Number of Terminations: 2; Termination: SMD/SMT; Voltage Rating (DC): 50V; Features: Moisture Resistant; Series: RC; Construction: Rectangular; Length: 0.039inch; Width: 0.02inch; Height: 0.016inch; Depth: 0.5mm; Radiation Hardening: No; Military Standard: Not; Lead Free: Lead Free; RoHS Compliant: Yes; ComponentLink1URL: https://datasheet.ciiva.com/16743/pyu-rc0402-51-rohs-l-6-r-16743909.pdf?src-supplier=Future+Electronics; ComponentLink1Description: https://datasheet.ciiva.com/16743/pyu-rc0402-51-rohs-l-6-r-16743909.pdf?src-supplier=Future+Electronics; Supplier Part Number 1: RC0402FR-07196RL
RF2 = WR04X66R5FTL: 62.5mW 50V ±1% ±100ppm/℃ -55℃~+155℃ 66.5Ω 0402 Chip Resistor - Surface Mount ROHS; Manufacturer: Walsin Tech Corp; Manufacturer Part Number: WR04X66R5FTL; Mount: Surface Mount; Case/Package: 0402; Case Code (Metric): 1005; Tolerance: 1%; Resistance: 66.5R; ComponentLink1Description: LCSC; ComponentLink1URL: https://www.lcsc.com/product-detail/span-style-background-color-ff0-Chip-span-span-style-background-color-ff0-Resistor-span-Surface-Mount_Walsin-Tech-Corp-WR04X66R5FTL_C368442.html
U2 = BQ51013BRHLR: IC WIRELESS PWR RCVR 20QFN; Manufacturer: Texas Instruments; Output Voltage: 5V; Output Current: 1.5A; Operating Supply Current: 8mA; Logic Function: Receiver; Supplier 1: Digi-Key; Manufacturer Part Number: BQ51013BRHLR; Stock 1: 15402; Pricing 1: 1=3.49, 10=3.119, 25=2.8068, 100=2.5572, 250=2.30768, 500=2.07068, 1000=1.74636 (USD); Mount: Surface Mount; Case/Package: VQFN; Number of Pins: 20; Contact Plating: Gold; Min Operating Temperature: 0°C; Max Operating Temperature: 125°C; Packaging: Tape and Reel; Package Quantity: 3000; Lead Free: Lead Free; ComponentLink1URL: http://www.ti.com/lit/ds/symlink/bq51013b.pdf?src-supplier=Digi-Key; ComponentLink1Description: http://www.ti.com/lit/ds/symlink/bq51013b.pdf?src-supplier=Digi-Key; Supplier Part Number 1: 296-38885-6-ND
U3 = BQ25616JRTWR: IC BATT CHG LI-ION 1CELL 24WQFN; Manufacturer: Texas Instruments; Supplier 1: Mouser; Manufacturer Part Number: BQ25616JRTWR; RoHS: Yes; Category: Battery Management; Pricing 1: 1=3.06000, 10=2.75000, 25=2.60000, 50=2.60000, 100=2.26000, 250=2.14000, 500=1.92000, 1000=1.68000, 3000=1.67000, 10000=1.67000 (USD); ComponentLink1URL: http://www.ti.com/general/docs/suppproductinfo.tsp?distId=10&amp;gotoUrl=http%3A%2F%2Fwww.ti.com%2Flit%2Fgpn%2Fbq25616&src-supplier=Digi-Key; ComponentLink1Description: http://www.ti.com/general/docs/suppproductinfo.tsp?distId=10&amp;gotoUrl=http%3A%2F%2Fwww.ti.com%2Flit%2Fgpn%2Fbq25616&src-supplier=Digi-Key; Supplier Part Number 1: 595-BQ25616JRTWR